# Altium schematic sheet 16_Misc.SchDoc
size 508 x 381 mm; SheetNumber: 16; SheetTotal: 16
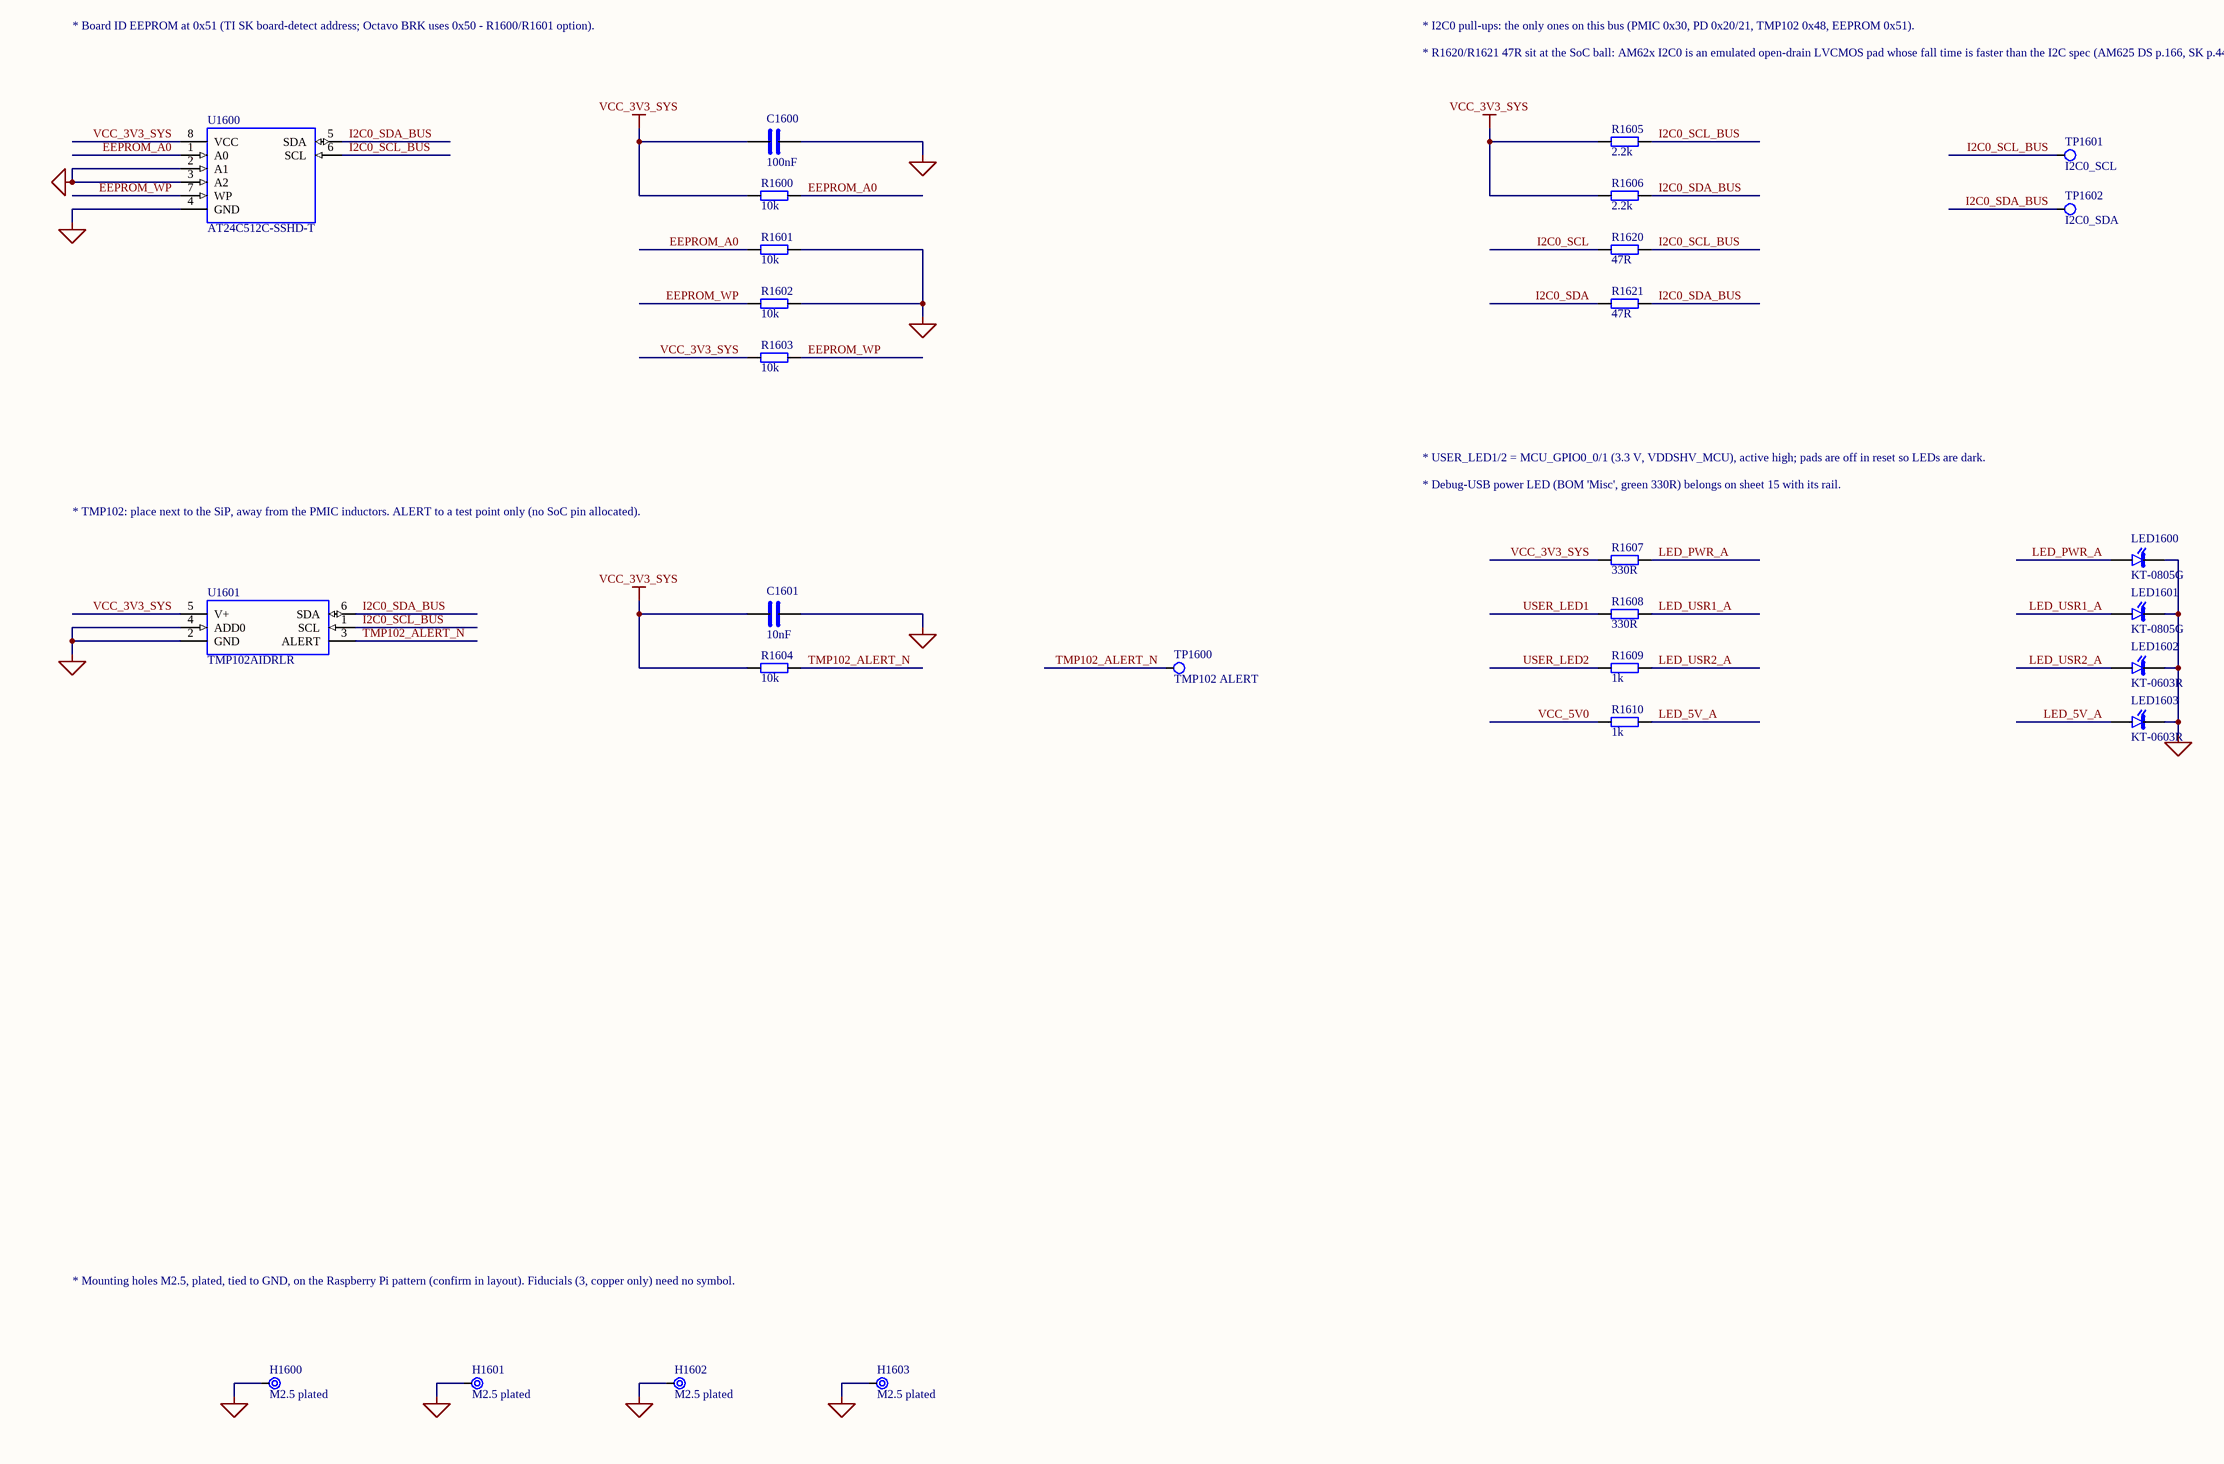
[diagram p0: 16_Misc.SchDoc]

## Parts
C1600  100nF  [C0402]
C1601  10nF  [C0402]
H1600  M2.5 plated  [MH_M2.5_PLATED]
H1601  M2.5 plated  [MH_M2.5_PLATED]
H1602  M2.5 plated  [MH_M2.5_PLATED]
H1603  M2.5 plated  [MH_M2.5_PLATED]
LED1600  KT-0805G  [LED0805]
LED1601  KT-0805G  [LED0805]
LED1602  KT-0603R  [LED0603]
LED1603  KT-0603R  [LED0603]
R1600  10k  [R0402]
R1601  10k  [R0402]
R1602  10k  [R0402]
R1603  10k  [R0402]
R1604  10k  [R0402]
R1605  2.2k  [R0402]
R1606  2.2k  [R0402]
R1607  330R  [R0402]
R1608  330R  [R0402]
R1609  1k  [R0402]
R1610  1k  [R0402]
R1620  47R  [R0402]
R1621  47R  [R0402]
TP1600  TMP102 ALERT  [TP_PAD_1.0]
TP1601  I2C0_SCL  [TP_PAD_1.0]
TP1602  I2C0_SDA  [TP_PAD_1.0]
U1600  AT24C512C-SSHD-T  [SOIC8_3.9X4.9_P1.27]
U1601  TMP102AIDRLR  [SOT563-6]

## Nets
GND: C1600.2 C1601.2 H1600.1(MH) H1601.1(MH) H1602.1(MH) H1603.1(MH) LED1600.2(K) LED1601.2(K) LED1602.2(K) LED1603.2(K) R1601.2 R1602.2 U1600.2(A1) U1600.3(A2) U1600.4(GND) U1601.2(GND) U1601.4(ADD0)
VCC_3V3_SYS: C1600.1 C1601.1 R1600.1 R1603.1 R1604.1 R1605.1 R1606.1 R1607.1 U1600.8(VCC) U1601.5(V+)
EEPROM_A0: R1600.2 R1601.1 U1600.1(A0)
EEPROM_WP: R1602.1 R1603.2 U1600.7(WP)
I2C0_SCL: R1620.1
I2C0_SCL_BUS: R1605.2 R1620.2 TP1601.1(TP) U1600.6(SCL) U1601.1(SCL)
I2C0_SDA: R1621.1
I2C0_SDA_BUS: R1606.2 R1621.2 TP1602.1(TP) U1600.5(SDA) U1601.6(SDA)
LED_5V_A: LED1603.1(A) R1610.2
LED_PWR_A: LED1600.1(A) R1607.2
LED_USR1_A: LED1601.1(A) R1608.2
LED_USR2_A: LED1602.1(A) R1609.2
TMP102_ALERT_N: R1604.2 TP1600.1(TP) U1601.3(ALERT)
USER_LED1: R1608.1
USER_LED2: R1609.1
VCC_5V0: R1610.1

## Notes on the sheet
- * Board ID EEPROM at 0x51 (TI SK board-detect address; Octavo BRK uses 0x50 - R1600/R1601 option).
- * I2C0 pull-ups: the only ones on this bus (PMIC 0x30, PD 0x20/21, TMP102 0x48, EEPROM 0x51).
- * R1620/R1621 47R sit at the SoC ball: AM62x I2C0 is an emulated open-drain LVCMOS pad whose fall time is faster than the I2C spec (AM625 DS p.166, SK p.44).
- * USER_LED1/2 = MCU_GPIO0_0/1 (3.3 V, VDDSHV_MCU), active high; pads are off in reset so LEDs are dark.
- * TMP102: place next to the SiP, away from the PMIC inductors. ALERT to a test point only (no SoC pin allocated).
- * Debug-USB power LED (BOM 'Misc', green 330R) belongs on sheet 15 with its rail.
- * Mounting holes M2.5, plated, tied to GND, on the Raspberry Pi pattern (confirm in layout). Fiducials (3, copper only) need no symbol.

## Library data of the parts
C1600 = CAP: Capacitor, non-polarized; Spec: 100nF 16V X7R 0402 (U1600 VCC)
C1601 = CAP: Capacitor, non-polarized; Spec: 10nF 50V X7R 0402 (U1601 V+, DS 7.3)
H1600-H1603 = MOUNTING_HOLE: Plated mounting hole (pin to GND)
LED1600 = LED: LED (pin 1 = anode); Manufacturer: Hubei KENTO; Spec: KT-0805G green (3V3); MPN: KT-0805G
LED1601 = LED: LED (pin 1 = anode); Manufacturer: Hubei KENTO; Spec: KT-0805G green (USER_LED1 heartbeat); MPN: KT-0805G
LED1602 = LED: LED (pin 1 = anode); Manufacturer: Hubei KENTO; Spec: KT-0603R red (USER_LED2); MPN: KT-0603R
LED1603 = LED: LED (pin 1 = anode); Manufacturer: Hubei KENTO; Spec: KT-0603R red (VCC_5V0); MPN: KT-0603R
R1600 = RES: Resistor; Spec: 10k 1% 0402 (A0 = 1 -> 0x51)
R1601 = RES: Resistor; DNP: 1; Spec: 10k 1% 0402 DNP (fit instead of R1600 for 0x50)
R1602 = RES: Resistor; Spec: 10k 1% 0402 (WP low = writable, as SK)
R1603 = RES: Resistor; DNP: 1; Spec: 10k 1% 0402 DNP (write-protect: fit instead of R1602)
R1604 = RES: Resistor; Spec: 10k 1% 0402 (ALERT open drain)
R1605 = RES: Resistor; Spec: 2.2k 1% 0402 (I2C0 SCL pull-up)
R1606 = RES: Resistor; Spec: 2.2k 1% 0402 (I2C0 SDA pull-up)
R1607 = RES: Resistor; Spec: 330R 1% 0402 (power LED)
R1608 = RES: Resistor; Spec: 330R 1% 0402 (heartbeat, ~1.5 mA)
R1609 = RES: Resistor; Spec: 1k 1% 0402 (user 2, ~1.3 mA)
R1610 = RES: Resistor; Spec: 1k 1% 0402 (5 V present, ~3 mA)
R1620 R1621 = RES: Resistor; Spec: 47R 1% 0402 (series at the SoC ball, SK p.44)
TP1600-TP1602 = TESTPOINT: Test point
U1600 = AT24C512C_SOIC8: 512 Kbit I2C EEPROM, SOIC-8 (SSHD: 2.5-5.5 V); Manufacturer: Microchip; MPN: AT24C512C-SSHD-T
U1601 = TMP102_DRL: TMP102 digital temperature sensor, I2C, SOT-563; Manufacturer: Texas Instruments; MPN: TMP102AIDRLR